# EAGLE design fuente_buck_50v-12v_10A_v1.9 (EAGLE 7.6.0)
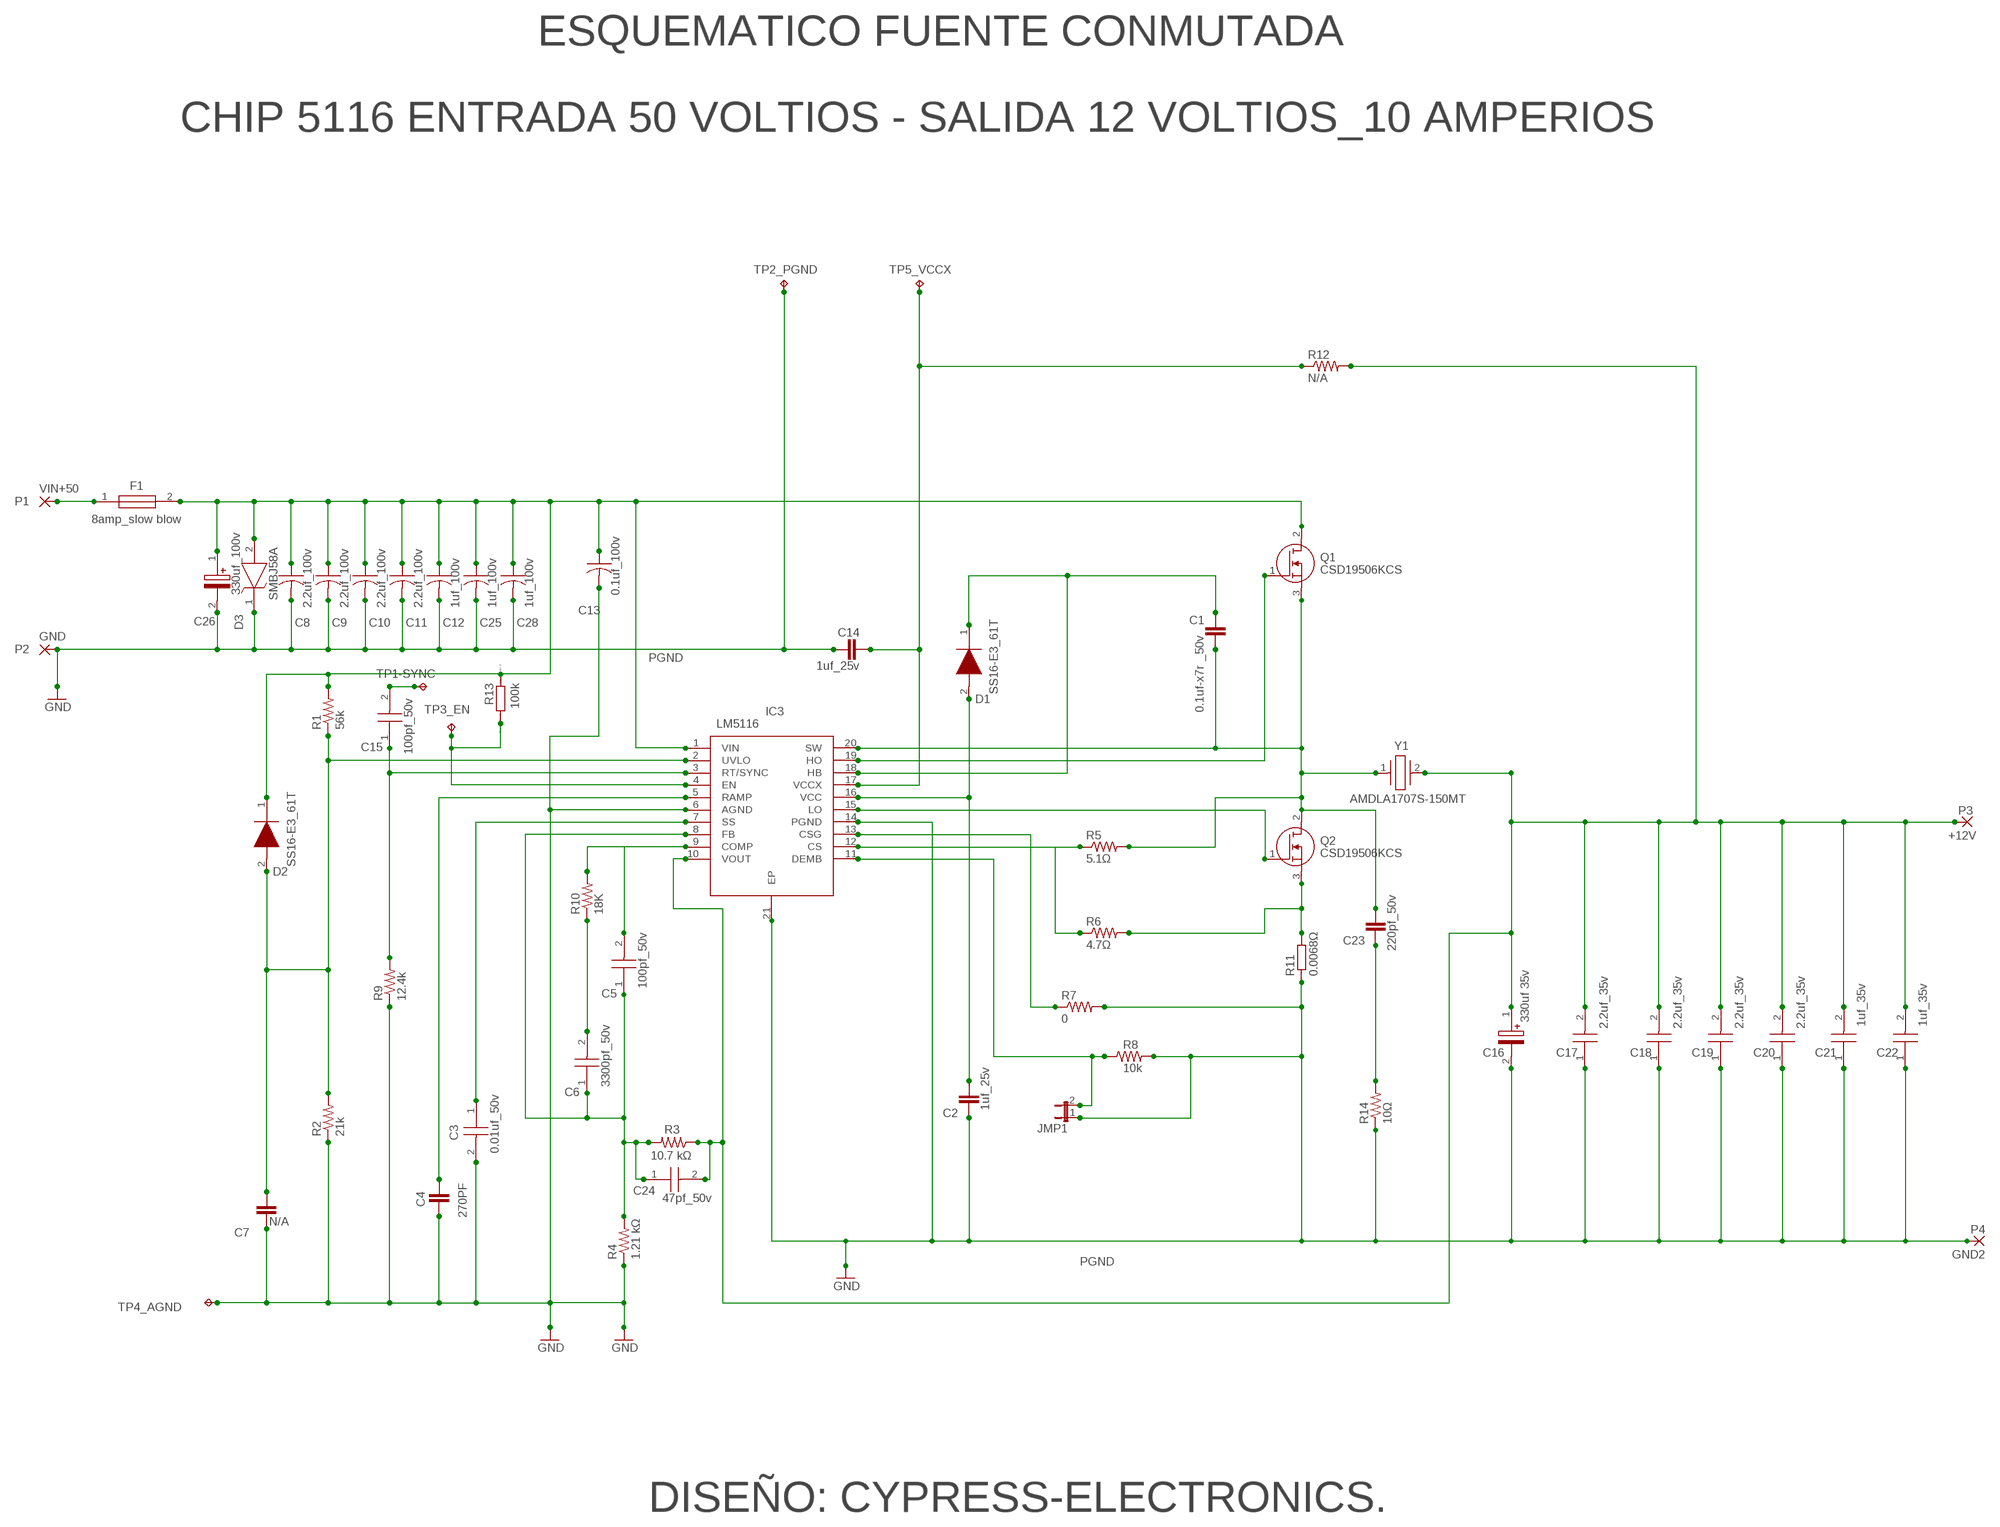
[diagram p0: schematic, sheet 1]

## Parts
+12V  P3  2,54/1,1  [2,54/1,1]
C1  0.1uf-x7r _50v  C-EUC0805  [C0805]
C2  1uf_25v  C-EUC0805  [C0805]
C3  0.01uf_50v  CGA3E2C0G1H221J080AD  [CAPC1608X90N]
C4  270PF  C-EUC0805  [C0805]
C5  100pf_50v  CGA3E2C0G1H221J080AD  [CAPC1608X90N]
C6  3300pf_50v  CGA3E2C0G1H221J080AD  [CAPC1608X90N]
C7  N/A  C-EUC0805  [C0805]
C8  2.2uf_100v  C-USC1206  [C1206]
C9  2.2uf_100v  C-USC1206  [C1206]
C10  2.2uf_100v  C-USC1206  [C1206]
C11  2.2uf_100v  C-USC1206  [C1206]
C12  1uf_100v  C-USC1206  [C1206]
C13  0.1uf_100v  C-USC1206  [C1206]
C14  1uf_25v  C-EUC0805  [C0805]
C15  100pf_50v  CGA3E2C0G1H221J080AD  [CAPC1608X90N]
C16  330uf 35v  EEEFK1V331P  [EEE0JA152UAP]
C17  2.2uf_35v  CL31B225KAHNNNE  [CAPC3216X180N]
C18  2.2uf_35v  CL31B225KAHNNNE  [CAPC3216X180N]
C19  2.2uf_35v  CL31B225KAHNNNE  [CAPC3216X180N]
C20  2.2uf_35v  CL31B225KAHNNNE  [CAPC3216X180N]
C21  1uf_35v  CL31B225KAHNNNE  [CAPC3216X180N]
C22  1uf_35v  CL31B225KAHNNNE  [CAPC3216X180N]
C23  220pf_50v  C-EUC0805  [C0805]
C24  47pf_50v  CGA3E2C0G1H221J080AD  [CAPC1608X90N]
C25  1uf_100v  C-USC1206  [C1206]
C26  330uf_100v  UCD2A331MNQ1MS  [CAPAE1910X1750N]
C28  1uf_100v  C-USC1206  [C1206]
D1  SS16-E3_61T  [DIOM5127X229N]
D2  SS16-E3_61T  [DIOM5127X229N]
D3  SMBJ58A  [DIOM5436X261N]
F1  8amp_slow blow  SF-1206S800W-2  [FUSC3216X123N]
GND  P2  2,54/1,1  [2,54/1,1]
GND2  P4  2,54/1,1  [2,54/1,1]
IC3  LM5116  LM5116MHX_NOPB  [SOP65P640X110-21N]
JMP1  JP1E  [JP1]
Q1  CSD19506KCS  [TO254P470X1016X1611-3P]
Q2  CSD19506KCS  [TO254P470X1016X1611-3P]
R1  56k  R-US_M0805  [M0805]
R2  21k  R-US_M0805  [M0805]
R3  10.7 kΩ  R-US_M0805  [M0805]
R4  1.21 kΩ  R-US_M0805  [M0805]
R5  5.1Ω  R-US_M0805  [M0805]
R6  4.7Ω  R-US_M0805  [M0805]
R7  0  R-US_M0805  [M0805]
R8  10k  R-US_M0805  [M0805]
R9  12.4k  R-US_M0805  [M0805]
R10  18K  R-US_M0805  [M0805]
R11  0.0068Ω  R-EU_R2512  [R2512]
R12  N/A  R-US_M0805  [M0805]
R13  100k  R  [R0805]
R14  10Ω  R-US_M0805  [M0805]
TP1-SYNC  TP1  TPPAD1-13  [P1-13]
TP2_PGND  TPPAD1-13  [P1-13]
TP3_EN  TPPAD1-13  [P1-13]
TP4_AGND  TPPAD1-13  [P1-13]
TP5_VCCX  TPPAD1-13  [P1-13]
VIN+50  P1  2,54/1,1  [2,54/1,1]
Y1  AMDLA1707S-150MT  [INDPM178169X700N]

## Nets
10K [power]: C2.1 D1.2(A) IC3.16(VCC)
GND [power]: C2.2 C3.2 C4.2 C7.2 C8.2 C9.2 C10.2 C11.2 C12.2 C13.2 C14.1 C16.2(-) C17.1 C18.1 C19.1 C20.1 C21.1 C22.1 C25.2 C26.2(-) C28.2 D3.1(K) GND2.1(P) GND.1(P) IC3.6(AGND) IC3.14(PGND) IC3.21(EP) JMP1.1 R2.1 R4.1 R7.2 R8.2 R9.1 R11.1 R14.1 TP2_PGND.TP TP4_AGND.TP
N$1: C5.1 C6.1 C24.1 IC3.8(FB) R3.2 R4.2
N$2: F1.1 VIN+50.1(P)
N$3: C23.2 R14.2
N$4: C7.1 D2.2(A) IC3.2(UVLO) R1.1 R2.2
N$5: C15.1 IC3.3(RT/SYNC) R9.2
N$6: C15.2 TP1-SYNC.TP
N$7: C4.1 IC3.5(RAMP)
N$8: C3.1 IC3.7(SS)
N$9: C14.2 IC3.17(VCCX) R12.1 TP5_VCCX.TP
N$10: C5.2 IC3.9(COMP) R10.2
N$11: IC3.19(HO) Q1.1(G)
N$12: C6.2 R10.1
N$14: +12V.1(P) C16.1(+) C17.2 C18.2 C19.2 C20.2 C21.2 C22.2 C24.2 IC3.10(VOUT) R3.1 R12.2 Y1.2
N$16: IC3.4(EN) R13.1 TP3_EN.TP
N$18: IC3.15(LO) Q2.1(G)
N$19: C1.2 D1.1(K) IC3.18(HB)
N$20: IC3.13(CSG) R7.1
N$21: Q2.3(S) R6.2 R11.2
N$23: IC3.11(DEMB) JMP1.2 R8.1
N$24: IC3.12(CS) R5.1 R6.1
SW: C1.1 C23.1 IC3.20(SW) Q1.3(S) Q2.2(D) R5.2 Y1.1
VIN: C8.1 C9.1 C10.1 C11.1 C12.1 C13.1 C25.1 C26.1(+) C28.1 D2.1(K) D3.2(A) F1.2 IC3.1(VIN) Q1.2(D) R1.2 R13.2

## Notes on the sheet
- ESQUEMATICO FUENTE CONMUTADA
- CHIP 5116 ENTRADA 50 VOLTIOS - SALIDA 12 VOLTIOS_10 AMPERIOS
- PGND
- PGND
- DISEÑO: CYPRESS-ELECTRONICS.

## Library data of the parts
+12V GND GND2 VIN+50 = wirepad:2,54/1,1: THROUGH-HOLE PAD
C1 C2 C4 C7 C14 C23 = rcl:C-EU: CAPACITOR, European symbol
C3 C5 C6 C15 C24 = CGA3E2C0G1H221J080AD:CGA3E2C0G1H221J080AD: Multilayer Ceramic Capacitors MLCC - SMD/SMT EPXY 0603 50V, AEC-Q200, 220pF Source: Datasheet; DESCRIPTION: Multilayer Ceramic Capacitors MLCC - SMD/SMT EPXY 0603 50V, AEC-Q200, 220pF; HEIGHT: 0.9mm; MANUFACTURER_NAME: TDK; MANUFACTURER_PART_NUMBER: CGA3E2C0G1H221J080AD; MOUSER_PART_NUMBER: 810-CGA3E2C0G1H221JD; MOUSER_PRICE-STOCK: https://www.mouser.co.uk/ProductDetail/TDK/CGA3E2C0G1H221J080AD?qs=xLDY6iXSiQauXd%252Brvgz98g%3D%3D
C8-C13 C25 C28 = rcl:C-US: CAPACITOR, American symbol
C16 = EEEFK1V331P:EEEFK1V331P: SMD Aluminium Electrolytic Capacitor,Radial Can - SMD, 330 F, 35 V, FK Series, 2000 hours @ 105C Source: Datasheet <http://industrial.panasonic.com/cdbs/www-data/pdf/RDE0000/ABA0000C1181.pdf>; DESCRIPTION: SMD Aluminium Electrolytic Capacitor,Radial Can - SMD, 330 F, 35 V, FK Series, 2000 hours @ 105C; HEIGHT: 12mm; MANUFACTURER_NAME: Panasonic; MANUFACTURER_PART_NUMBER: EEEFK1V331P
C17-C22 = CL31B225KAHNNNE:CL31B225KAHNNNE: Samsung Electro-Mechanics 1206 CL 2.2uF Ceramic Multilayer Capacitor, 25 V, +125C, X7R Dielectric, +/-10% SMD Source: Datasheet <https://www.mouser.in/datasheet/2/585/MLCC-1837944.pdf>; DESCRIPTION: Samsung Electro-Mechanics 1206 CL 2.2uF Ceramic Multilayer Capacitor, 25 V, +125C, X7R Dielectric, +/-10% SMD; HEIGHT: 1.8mm; MANUFACTURER_NAME: SAMSUNG; MANUFACTURER_PART_NUMBER: CL31B225KAHNNNE
C26 = UCD2A331MNQ1MS:UCD2A331MNQ1MS: Nichicon 330F 100V dc Aluminium Electrolytic Capacitor, Surface Mount 18 (Dia.) x 16.5mm +105C 18mm Source: Datasheet <http://nichicon-us.com/english/products/pdfs/e-ucd.pdf>; DESCRIPTION: Nichicon 330F 100V dc Aluminium Electrolytic Capacitor, Surface Mount 18 (Dia.) x 16.5mm +105C 18mm; HEIGHT: 17.5mm; MANUFACTURER_NAME: Nichicon; MANUFACTURER_PART_NUMBER: UCD2A331MNQ1MS
D1 D2 = SS16-E3_61T:SS16-E3_61T: Vishay SS16-E3/61T, SMT Schottky Diode, 60V 1A, 2-Pin DO-214AC Source: Datasheet <https://componentsearchengine.com/Datasheets/2/SS16-E3_61T.pdf>; DESCRIPTION: Vishay SS16-E3/61T, SMT Schottky Diode, 60V 1A, 2-Pin DO-214AC; HEIGHT: 2.29mm; MANUFACTURER_NAME: Vishay; MANUFACTURER_PART_NUMBER: SS16-E3/61T; MOUSER_PART_NUMBER: 625-SS16-E3; MOUSER_PRICE-STOCK: https://www.mouser.co.uk/ProductDetail/Vishay-General-Semiconductor/SS16-E3-61T?qs=x2jpVgRnAtMiLlJLdPGu3w%3D%3D
D3 = SMBJ58A:SMBJ58A: Littelfuse SMBJ58A, Uni-Directional TVS Diode, 600W, 2-Pin DO-214AA Source: Datasheet <https://m.littelfuse.com/~/media/electronics/datasheets/tvs_diodes/littelfuse_tvs_diode_smbj_datasheet.pdf.pdf>; DESCRIPTION: Littelfuse SMBJ58A, Uni-Directional TVS Diode, 600W, 2-Pin DO-214AA; HEIGHT: 2.61mm; MANUFACTURER_NAME: LITTELFUSE; MANUFACTURER_PART_NUMBER: SMBJ58A
F1 = SF-1206S800W-2:SF-1206S800W-2: Surface Mount Fuses 8.0A Slow Blow 1206 SinglFuse Source: Datasheet <https://componentsearchengine.com/Datasheets/2/SF-1206S800W-2.pdf>; DESCRIPTION: Surface Mount Fuses 8.0A Slow Blow 1206 SinglFuse; HEIGHT: 1.23mm; MANUFACTURER_NAME: Bourns; MANUFACTURER_PART_NUMBER: SF-1206S800W-2; MOUSER_PART_NUMBER: 652-SF-1206S800W-2; MOUSER_PRICE-STOCK: https://www.mouser.co.uk/ProductDetail/Bourns/SF-1206S800W-2/?qs=fAHHVMwC%252BbhqdiwPMKxViA%3D%3D
IC3 = LM5116MHX_NOPB:LM5116MHX_NOPB: 6-100V Wide Vin, Current Mode Synchronous Buck Controller Source: Datasheet <http://www.ti.com/lit/gpn/lm5116>; DESCRIPTION: 6-100V Wide Vin, Current Mode Synchronous Buck Controller; HEIGHT: 1.1mm; MANUFACTURER_NAME: Texas Instruments; MANUFACTURER_PART_NUMBER: LM5116MHX/NOPB; MOUSER_PART_NUMBER: 926-LM5116MHX/NOPB; MOUSER_PRICE-STOCK: https://www.mouser.co.uk/ProductDetail/Texas-Instruments/LM5116MHX-NOPB?qs=QbsRYf82W3EaCl%2FW15P7yA%3D%3D
JMP1 = jumper:JP1E: JUMPER
Q1 Q2 = CSD19506KCS:CSD19506KCS: Texas Instruments CSD19506KCS N-channel MOSFET Transistor, 273 A, 80 V, 3-Pin TO-220 Source: Datasheet <http://www.ti.com/lit/gpn/csd19506kcs>; DESCRIPTION: Texas Instruments CSD19506KCS N-channel MOSFET Transistor, 273 A, 80 V, 3-Pin TO-220; HEIGHT: 4.7mm; MANUFACTURER_NAME: Texas Instruments; MANUFACTURER_PART_NUMBER: CSD19506KCS; MOUSER_PART_NUMBER: 595-CSD19506KCS; MOUSER_PRICE-STOCK: https://www.mouser.co.uk/ProductDetail/Texas-Instruments/CSD19506KCS?qs=8sOby8ZxZLGQrkLPFGWmvQ%3D%3D
R1-R10 R12 R14 = rcl:R-US_: RESISTOR, American symbol
R11 = resistor:R-EU_: RESISTOR, European symbol
R13 = eagle-ltspice:R: RESISTOR, European symbol; SPICEMODEL: NONE; SPICEPREFIX: R
TP1-SYNC TP2_PGND TP3_EN TP4_AGND TP5_VCCX = testpad:TP: Test pad
Y1 = AMDLA1707S-150MT:AMDLA1707S-150MT: 15 H Shielded Molded Inductor 16 A 15.5mOhm Max Nonstandard - Source: Datasheet <https://abracon.com/datasheets/AMDLA1707S.pdf>; DESCRIPTION: 15 H Shielded Molded Inductor 16 A 15.5mOhm Max Nonstandard -; HEIGHT: 7mm; MANUFACTURER_NAME: ABRACON; MANUFACTURER_PART_NUMBER: AMDLA1707S-150MT; MOUSER_PART_NUMBER: 815-AMDLA1707S-150MT; MOUSER_PRICE-STOCK: https://www.mouser.co.uk/ProductDetail/ABRACON/AMDLA1707S-150MT?qs=DPoM0jnrROXZdMVrsDE%2FmQ%3D%3D

## Net classes
0 default: width 0.152 mm, drill 0.305 mm, clearance 0.152 mm
1 power: width 0.127 mm, drill 0.305 mm, clearance 0.127 mm
2 thin: width 0.508 mm, drill 0.305 mm, clearance 0.152 mm

## Board
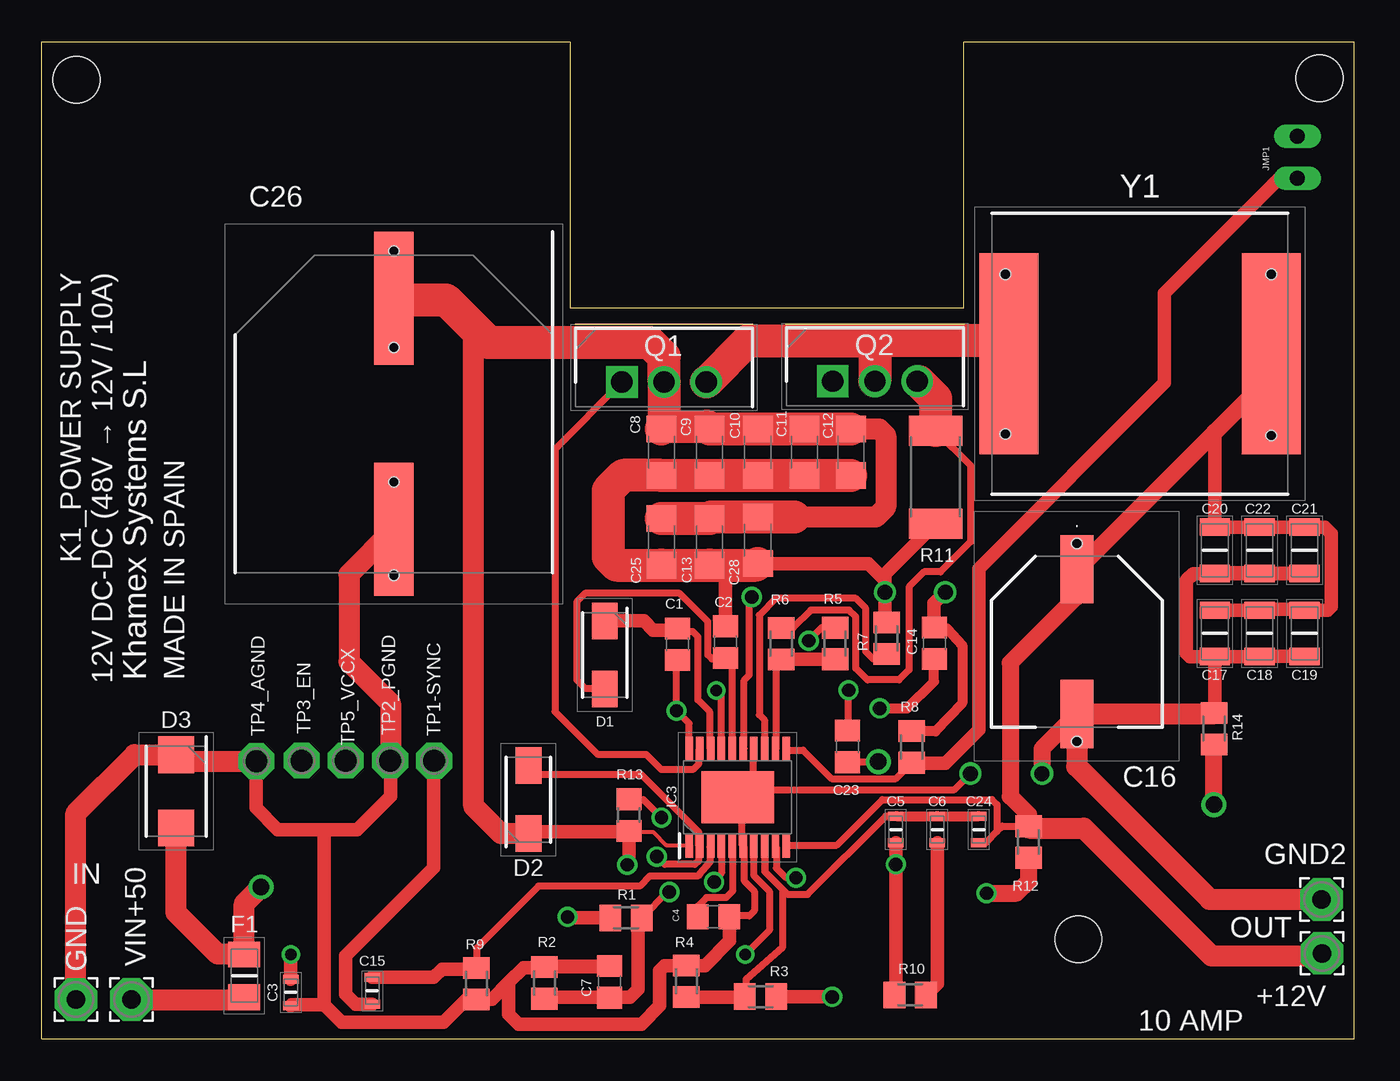
[diagram p1: board, top side]
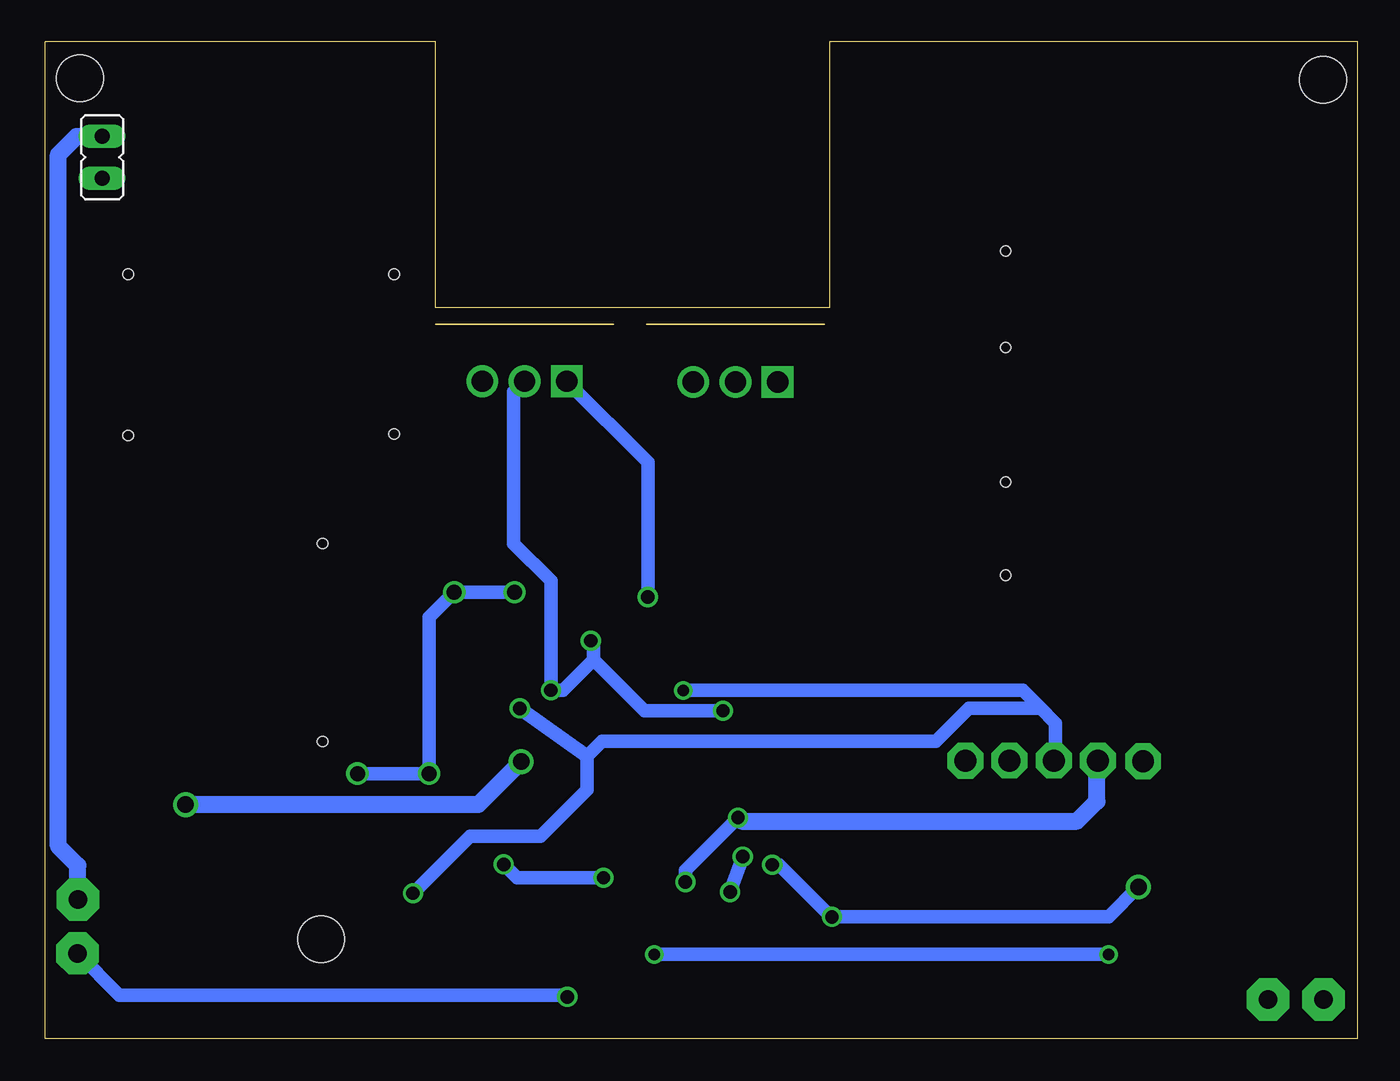
[diagram p2: board, bottom side, seen from below]

Size 79 x 60 mm. Coordinates in mm from the lower left corner, seen from the top.
Outline: 42.8,43 32.1,43
Outline: 55.5,43 44.8,43
Outline: 0,0 79,0 79,60 55.5,60 55.5,44 31.8,44 31.8,60 0,60 0,0
Copper layers (1*16): Top 0.035mm / dielectric 1.5mm / Bottom 0.035mm
Design rules "default": minimum track width 10mil, minimum drill 24mil, track to track 8mil, track to pad 8mil, pad to pad 8mil, via to via 8mil, smd to smd 8mil, copper to edge 40mil, drill to drill 8mil, minimum pad ring 10mil, minimum via ring 8mil, stop-mask expansion 4mil, vias tented up to drill 0mil, thermal gap 10mil
Holes 2.8 mm at 76.9,57.8 2.1,57.7 62.4,6
Holes 0.6 mm at 21.2,33.5 21.2,27.9 21.2,41.6 21.2,47.4 58,46 58,36.4 74,46 74,36.3 62.3,29.8 62.3,17.9

### Footprints (pad centres in the part's own frame; a part is rotated, then mirrored left to right if it is on the bottom)
2,54/1,1 = drill 1.118 pad 2.54 octagon: 1 0,0
C0805 = smd 1.3 x 1.5: 1 -0.95,0; 2 0.95,0
CAPC1608X90N = smd 0.54 x 0.94: 1 -0.8,0; 2 0.8,0
C1206 = smd 1.6 x 1.8: 1 -1.4,0; 2 1.4,0
EEE0JA152UAP = smd 4.1 x 2: 1 -4.35,0; 2 4.35,0
CAPC3216X180N = smd 1.05 x 1.82: 1 -1.39,0; 2 1.39,0
CAPAE1910X1750N = smd 8 x 2.4: 1 -6.95,0; 2 6.95,0
DIOM5127X229N = smd 2.2 x 1.55: 1 -2.05,0; 2 2.05,0
DIOM5436X261N = smd 2.2 x 2.15: 1 -2.2,0; 2 2.2,0
FUSC3216X123N = smd 1.55 x 1.91: 1 -1.285,0; 2 1.285,0
SOP65P640X110-21N = smd 1.45 x 0.45: 1 -2.925,2.925; 2 -2.925,2.275; 3 -2.925,1.625; 4 -2.925,0.975; 5 -2.925,0.325; 6 -2.925,-0.325; 7 -2.925,-0.975; 8 -2.925,-1.625; 9 -2.925,-2.275; 10 -2.925,-2.925; 11 2.925,-2.925; 12 2.925,-2.275; 13 2.925,-1.625; 14 2.925,-0.975; 15 2.925,-0.325; 16 2.925,0.325; 17 2.925,0.975; 18 2.925,1.625; 19 2.925,2.275; 20 2.925,2.925 | smd 3.15 x 4.35: 21 0,0
JP1 = drill 0.914 long: 1 0,-1.27; 2 0,1.27
TO254P470X1016X1611-3P = drill 1.28 pad 1.92 square: 1 0,0 | drill 1.28 pad 1.92: 2 2.54,0; 3 5.08,0
M0805 = smd 1.3 x 1.6: 1 -0.95,0; 2 0.95,0
R2512 = smd 1.8 x 3.2: 1 -2.8,0; 2 2.8,0
R0805 = smd 1.3 x 1.5: 1 -0.95,0; 2 0.95,0
P1-13 = drill 1.321 pad 2.159 octagon: TP 0,0
INDPM178169X700N = smd 3.55 x 12.1: 1 -7.9,0; 2 7.9,0

### Placement (x,y rotation side)
+12V  77.05,5.15 0 top
C1  38.26,23.75 90 top
C2  41.16,23.88 90 top
C3  15,2.8 270 top
C4  40.43,7.35 0 top
C5  51.4,12.6 270 top
C6  53.9,12.6 270 top
C7  34.19,3.43 90 top
C8  37.3,35.3 270 top
C9  40.2,35.3 270 top
C10  43.1,35.3 270 top
C11  45.9,35.3 270 top
C12  48.7,35.3 270 top
C13  40.2,29.9 270 top
C14  53.74,23.81 270 top
C15  19.9,2.9 270 top
C16  62.3,23.9 270 top
C17  70.6,24.4 90 top
C18  73.3,24.4 90 top
C19  76,24.4 90 top
C20  70.6,29.4 90 top
C21  73.3,29.4 90 top
C22  76,29.4 90 top
C23  48.5,17.6 270 top
C24  56.4,12.6 270 top
C25  37.3,29.9 270 top
C26  21.2,37.6 270 top
C28  43.1,30 270 top
D1  33.9,23.1 270 top
D2  29.3,14.4 90 top
D3  8.1,14.9 270 top
F1  12.2,3.8 90 top
GND  2.07,2.37 270 top
GND2  77.03,8.39 0 top
IC3  41.89,14.54 90 top
JMP1  75.57,53.04 180 bottom
Q1  34.92,39.52 0 top
Q2  47.61,39.57 0 top
R1  35.17,7.29 180 top
R2  30.26,3.37 270 top
R3  43.27,2.55 180 top
R4  38.8,3.47 270 top
R5  47.75,23.79 90 top
R6  44.51,23.78 90 top
R7  50.86,24.11 90 top
R8  52.36,17.57 90 top
R9  26.17,3.33 90 top
R10  52.27,2.65 180 top
R11  53.8,33.8 90 top
R12  59.39,11.85 90 top
R13  35.34,13.47 270 top
R14  70.56,18.67 270 top
TP1-SYNC  23.63,16.73 0 top
TP2_PGND  20.98,16.75 0 top
TP3_EN  15.66,16.75 0 top
TP4_AGND  12.93,16.71 0 top
TP5_VCCX  18.3,16.75 0 top
VIN+50  5.41,2.37 0 top
Y1  66.1,41.22 0 top

### Tracks (layer width: path | path; a pad name or v marks a point on that pad's centre or on a via)
10K
  Top 0.254: 41.71,22.63 41.59,22.75 C2.1 41.48,22.86 | 41.59,17.49 IC3.16 | 33.82,21.14 D1.2
  Top 0.406: 41.59,17.49 41.59,22.52 41.71,22.63 | 41.48,22.86 40.34,22.86 40.1,23.1 40.1,25.1 38.4,26.8 32.7,26.8 32.2,26.3 32.2,21.6 32.7,21.1 33.85,21.1 D1.2
GND  (via drill 0.9)
  Top 0.254: 42.16,14.29 41.94,14.52 IC3.21 | 42.16,11.66 IC3.6 42.28,11.54 | 42.85,15.54 41.94,14.63 IC3.21 | 42.85,17.37 IC3.14 | 34.16,4.34 C7.2 | 30.28,4.34 R2.1 30.16,4.23 | 26.16,2.29 R9.1 26.28,2.4 | 21.13,30.63 C26.2 | 49.36,33.95 C12.2 | 53.82,24.69 C14.1 53.71,24.8 | 51.76,18.63 R8.2 | 50.74,24.8 R7.2 | 53.59,30.98 R11.1 | 70.81,19.72 R14.1 | 70.61,23 C17.1 70.72,23 | 75.98,23 C19.1 | 70.61,28.03 C20.1 | 75.98,28.03 C22.1 | 62.28,19.66 C16.2 | 42.96,15.54 IC3.21
  Top 0.406: 42.28,11.54 42.28,9.52 42.9,8.9 42.9,7.7 42.6,7.4 41.43,7.4 C4.2 | 42.96,15.54 43.51,15 54.93,15 v55.89,15.96 | 50.75,24.85 R7.2 | 42.16,11.66 42.16,14.27 IC3.21 | 42.85,15.54 42.85,17.45 IC3.14
  Top 0.61: 53.82,24.69 54.51,24.69 55.4,23.7 55.4,20.2 53.8,18.5 52.38,18.5 R8.2
  Top 0.813: C3.2 15.06,2.06 17,2.06 | 17,2.06 18.06,1 24.2,1 25.58,2.38 R9.1 | 26.28,2.4 27.1,2.4 28.1,3.4 | 30,4.3 30.24,4.3 R2.1 30.28,4.34 34.16,4.34 | C7.2 30.28,4.38 30.1,4.2 30,4.3 | 30,4.3 29,4.3 28.1,3.4 | 28.1,3.4 28.1,1.5 28.7,0.9 36.1,0.9 37.2,2 37.2,4.1 37.5,4.4 38.78,4.4 R4.1 39.92,4.42 41.4,5.9 41.4,7.33 C4.2 | 53.71,24.8 53.71,26.2 v54.38,26.88 | 50.75,24.85 v50.75,26.88 50.75,27.6 | 50.75,27.6 50.75,27.95 R11.1 | C28.2 49.75,28.6 50.75,27.6 | 62.25,19.5 C16.2 | C13.2 41.16,28.5 C2.2 | 70.61,28.03 73.28,28.03 C21.1 C22.1 69.3,28 68.9,27.6 68.9,23.2 69.1,23 C17.1 70.61,23 70.61,19.67 R14.1 | 70.72,23 C18.1 C19.1 | 16.9,12.6 19,12.6 21,14.6 21,16.73 TP2_PGND.TP | 17,2.06 17,12.5 16.9,12.6 | 16.9,12.6 14.2,12.6 12.9,13.9 12.9,16.68 TP4_AGND.TP
  Top 1.016: 62.25,19.5 60.21,17.46 v60.21,15.96
  Top 1.27: C26.2 18.5,27.95 18.5,22.7 21,20.2 21,16.77 TP2_PGND.TP | GND.1 2.07,13.57 5.6,17.1 D3.1 8.1,16.71 TP4_AGND.TP | GND2.1 70.3,8.4 62.3,16.4 C16.2 70.49,19.55 R14.1
  Top 2: C12.2 C11.2 C10.2 C9.2 C8.2 35,33.9 34.1,33 34.1,29 34.6,28.5 C25.2 C13.2 43,28.5 C28.2
  Bottom 0.813: v50.75,26.88 v54.38,26.88 55.89,25.36 v55.89,15.96 59.01,15.96 v60.21,15.96
  Bottom 1.016: GND2.1 77.03,10.43 78.2,11.6 78.2,53.2 77.1,54.3 JMP1.1
N$1
  Top 0.254: 51.42,13.37 C5.1 | 56.34,13.37 C24.1 | 43.53,11.54 IC3.8
  Top 0.406: 43.53,11.54 43.53,10.06 44.6,9 44.6,5.52 42.4,3.6 R3.2 | IC3.8 43.52,10.09 44.9,8.7 46.1,8.7 50.8,13.4 C5.1 | 51.42,13.37 51.45,13.4
  Top 0.61: 51.45,13.4 C6.1 C24.1
  Top 0.813: R4.2 42.29,2.52 R3.2
N$2
  Top 1.27: VIN+50.1 12.05,2.37 F1.1
N$3  (via drill 1)
  Top 0.254: 48.56,16.69 C23.2 | 70.61,17.86 R14.2
  Top 0.406: 70.85,17.71 R14.2 | 48.56,16.69 v50.35,16.69
  Top 0.813: R14.2
  Top 1.016: v70.55,14.1 R14.2
  Bottom 1.016: v50.35,16.69 52.94,14.1 69.4,14.1 v70.55,14.1
N$4  (via drill 0.8)
  Top 0.254: 34.16,2.52 C7.1 34.28,2.52 | 30.28,2.52 R2.2 | 29.82,15.89 29.36,16.34 D2.2 | 39.53,11.66 IC3.2 39.53,11.54
  Top 0.406: v37.78,8.84 37.67,8.84 R1.1 | 39.53,11.54 39.53,10.73 39.3,10.5 37.49,10.5 v37.02,10.97 | 39.53,11.66 39.53,12.47 36.1,15.9 29.81,15.9 | 29.3,15.9 29.81,15.9 | 29.81,15.9 29.82,15.89
  Top 0.813: 30.28,2.52 34.16,2.52 C7.1 | 34.28,2.52 35.41,2.52 35.9,3 35.9,7.07 R1.1
  Bottom 0.813: v37.02,10.97 v37.78,8.84
N$5
  Top 0.254: 25.7,3.77 26.16,4.23 R9.2 26.28,4.34 | 40.22,11.54 IC3.3
  Top 0.406: 40.22,11.54 40.22,10.62 39.6,9.9 39.5,9.8 36.6,9.8 36,9.2 29.9,9.2 26.17,5.47 R9.2
  Top 0.813: C15.1 23.6,3.7 24.1,4.2 26.09,4.2 R9.2
N$6
  Top 0.813: C15.2 18.9,2.1 18.3,2.7 18.3,5 23.6,10.3 23.6,16.7 TP1-SYNC.TP
N$7
  Top 0.254: 41.59,11.54 IC3.5
  Top 0.406: 41.59,11.54 41.59,8.89 41.2,8.5 40,8.5 39.5,8 39.5,7.37 C4.1
N$8  (via drill 0.7)
  Top 0.254: 42.85,11.54 IC3.7
  Top 0.406: 42.85,11.54 42.85,9.85 43.8,8.9 43.8,6.54 v42.35,5.09
  Top 0.813: v15,5.09 C3.1
  Bottom 0.813: v42.35,5.09 v15,5.09
N$9  (via drill 0.7, 0.8)
  Top 0.254: 40.91,17.49 IC3.17 | 53.71,22.86 C14.2 | 59.31,10.97 R12.1
  Top 0.406: 59.32,10.97 R12.1 | 40.91,17.49 40.91,20.66 v40.59,20.97
  Top 0.61: v50.44,19.89 52.09,19.89 53.7,21.5 53.7,22.82 C14.2
  Top 1.016: v56.87,8.77 58.67,8.77 59.4,9.5 R12.1
  Bottom 0.813: v56.87,8.77 53.44,12.2 49.2,12.2 46.4,15 46.4,17 | 46.4,17 v50.44,19.89 | 46.4,17 45.5,17.9 25.4,17.9 23.4,19.9 19.2,19.9 19.15,19.95 | v40.59,20.97 20.17,20.97 19.15,19.95 | 19.15,19.95 18.2,19 18.2,16.85 TP5_VCCX.TP
N$10  (via drill 0.8)
  Top 0.254: 51.42,11.77 C5.2 | 51.42,2.74 R10.2 | 44.22,11.54 IC3.9
  Top 0.406: 44.22,11.54 44.22,10.28 44.8,9.7 v45.4,9.7 | 51.42,10.48 v51.4,10.5
  Top 0.813: v51.4,10.5 C5.2 | 51.42,2.74 51.42,10.48
  Bottom 0.813: v51.4,10.5 50.6,9.7 v45.4,9.7
N$11
  Top 0.254: 39.53,17.37 IC3.19
  Top 0.406: 39.53,17.37 39.53,16.53 39.2,16.2 37.3,16.2 36.4,17.1 33.5,17.1 30.9,19.7 30.9,35.48 34.85,39.43 34.85,39.45 Q1.1
N$12
  Top 0.813: C6.2 53.9,3.33 R10.1
N$13
  Top 0.406: 62.3,27.6 62.4,27.6 62.4,28.2 62.3,28.2 | 62.3,27.6 62.3,28.2 | 62.3,28.4 62.3,28.3 62.3,28.2 | 62.3,28.2 62.2,28.2 62.2,27.2 62.3,27.2 62.3,27.6
N$14  (via drill 0.8)
  Top 0.254: 70.61,30.78 C20.2 | 75.98,30.78 C22.2 | 75.98,25.86 C19.2 | 70.5,25.86 C17.2 | 74.05,41.26 Y1.2 73.94,41.15 73.94,39.89 | 56.45,11.89 C24.2 | 59.31,12.69 R12.2 59.42,12.69 | 44.91,11.66 IC3.10 | 62.28,28.23 C16.1 | 62.39,28.35 C16.1 | C16.1 62.33,28.25 62.33,27.7
  Top 0.406: 44.91,11.66 47.86,11.66 50.6,14.4 57.2,14.4 57.5,14.1 57.5,12.49 | 57.5,12.49 56.81,11.8 C24.2 | 57.5,12.49 57.81,12.8 R12.2
  Top 0.813: R3.1 44.24,2.53 v47.58,2.53 | 62.4,28.3 62.33,28.23 62.33,27.7 62.33,26.65 62.28,26.6 | 73.94,39.89 | C17.2 C18.2 73.37,25.86 75.98,25.86 | Y1.2 74.58,41.8 74.58,40.48 70.6,36.5 C20.2 C21.2 C22.2 | 75.98,30.78 77.22,30.78 77.6,30.4 77.6,26 77.4,25.8 C19.2
  Top 1.016: 62.28,26.6 58.3,22.62 58.3,14.6 59.39,13.51 R12.2 | 62.33,28.23 70.6,36.5 73.94,39.84 73.94,39.89
  Top 1.27: 59.42,12.69 62.71,12.69 70.4,5 76.9,5 +12V.1
  Bottom 0.813: v47.58,2.53 47.68,2.63 74.53,2.63 +12V.1
N$16  (via drill 0.8)
  Top 0.254: 40.91,11.54 IC3.4 | 35.42,14.4 R13.1
  Top 0.406: 40.91,11.54 40.91,9.97 v40.48,9.44 | 35.42,14.4 36.22,14.4 v37.31,13.32
  Bottom 0.406: v37.3,13.31 v37.31,13.32
  Bottom 0.813: v40.48,9.44 40.48,10.14 v37.31,13.32 37.09,13.1
  Bottom 1.016: 37.09,13.1 16.9,13.1 15.7,14.3 15.7,16.71 TP3_EN.TP
N$18  (via drill 0.8)
  Top 0.254: 42.28,17.49 IC3.15
  Top 0.406: 42.28,17.49 42.28,21.58 42.6,21.9 42.6,26.45 v42.73,26.59
  Bottom 0.813: v42.73,26.59 42.73,34.7 Q2.1
N$19
  Top 0.254: 40.22,17.49 IC3.18 | 38.28,24.69 C1.2 38.16,24.8 37.82,25.15 | 33.93,25.15 D1.1
  Top 0.406: 40.22,17.49 40.22,19.68 39.5,20.4 39.5,24.2 39.2,24.5 38.46,24.5 C1.2
  Top 0.813: 33.93,25.15 36.25,25.15 36.8,24.6 38.16,24.6 C1.2
N$20
  Top 0.254: 43.42,17.49 IC3.13 | 50.62,22.86 R7.1
  Top 0.406: 50.62,22.86 50.04,22.86 49.6,23.3 49.6,25.9 49,26.5 44.2,26.5 43.2,25.5 43.2,19.5 43.5,19.2 43.5,17.48 IC3.13
N$21
  Top 0.254: 45.25,24.8 44.56,24.8 R6.2 | 53.71,36.58 R11.2 53.59,36.69
  Top 0.406: R11.2 55.9,34.5 55.9,29.9 54.1,28.1 53.1,28.1 52.2,27.2 52.2,22.2 51.6,21.6 49.7,21.6 49,22.3 49,25.4 48.6,25.8 46.3,25.8 45.23,24.73 R6.2 | Q2.3 52.77,39.57 52.79,39.55
  Top 2: 52.79,39.55 53.8,38.54 R11.2
N$23
  Top 0.254: 44.91,17.37 IC3.11 | 51.76,16.69 R8.1
  Top 0.406: R8.1 51.4,15.66 47.53,15.66 45.82,17.37 44.91,17.37
  Top 0.813: R8.1 52.38,16.6 54.4,16.6 56.4,18.6 56.4,28.3 67.57,39.47 67.57,44.87 74.4,51.7 75.5,51.7 JMP1.2
N$24
  Top 0.254: 44.22,22.52 44.45,22.75 R6.1 44.56,22.86 | 44.22,17.49 IC3.12 | 47.65,22.86 R5.1
  Top 0.406: 44.22,17.49 44.22,22.83 R6.1
  Top 0.813: 44.56,22.86 44.56,22.84 R5.1
SW  (via drill 0.8)
  Top 0.254: 38.96,17.49 IC3.20 | 38.28,22.75 C1.1 | 48.56,18.63 C23.1 | 47.65,24.69 R5.2 | 58.16,41.15 Y1.1
  Top 0.406: 48.56,18.63 v48.56,20.97 | v46.16,23.96 46.94,24.74 R5.2 | 38.96,17.49 38.96,18.99 v38.21,19.75 38.21,22.75 C1.1
  Top 2: Q1.3 42.48,42 50.15,42 | Y1.1 58.2,41.4 57.6,42 50.15,42 | 50.15,42 Q2.2
  Bottom 0.813: Q2.2 50.8,38.92 50.8,29.8 48.56,27.56 v48.56,20.97 47.83,20.97 46,22.8 | v38.21,19.75 42.95,19.75 46,22.8 | 46,22.8 46,23.8 v46.16,23.96
VIN  (via drill 0.8, 1)
  Top 0.254: IC3.1 38.96,11.66 37.59,11.66 36.79,12.46 35.42,12.46 R13.2 | 35.65,12.34 R13.2 | 29.36,12.46 D2.1 29.36,12.57 | 35.3,12.46 R13.2 | 21.25,44.46 C26.1
  Top 0.406: 35.25,12.43 R13.2
  Top 0.813: R1.2 31.7,7.29 v31.65,7.34 | 29.36,12.46 35.28,12.46 R13.2 35.34,10.58 v35.25,10.49
  Top 1.27: C10.1 50.4,36.7 50.8,36.3 50.8,32 50.2,31.4 45.3,31.4 | D2.1 27.65,12.35 26,14 26,42.8 26,43.1 | D3.2 8.5,12.3 8.1,11.9 8.1,7.6 10.6,5.1 12.19,5.1 F1.2 12.2,8.14 v13.2,9.14
  Top 2: 37.46,36.86 Q1.2 37.46,41.04 36.6,41.9 26.9,41.9 26,42.8 24.34,44.46 21.25,44.46 | 37.46,36.86 C8.1 | 37.46,36.86 40.04,36.86 C9.1 C10.1 C11.1 C12.1 | 45.3,31.4 C28.1 40.3,31.4 C13.1 C25.1
  Bottom 0.406: 31.7,7.4 v31.65,7.34
  Bottom 0.813: v13.2,9.14 15,7.34 v31.65,7.34 | 31.7,7.4 31.76,7.4 34.85,10.49 v35.25,10.49

### Text on the board
tPlace: K1_POWER SUPPLY / 12V DC-DC (48V → 12V / 10A) | Khamex Systems S.L | MADE IN SPAIN | IN | OUT | 10 AMP